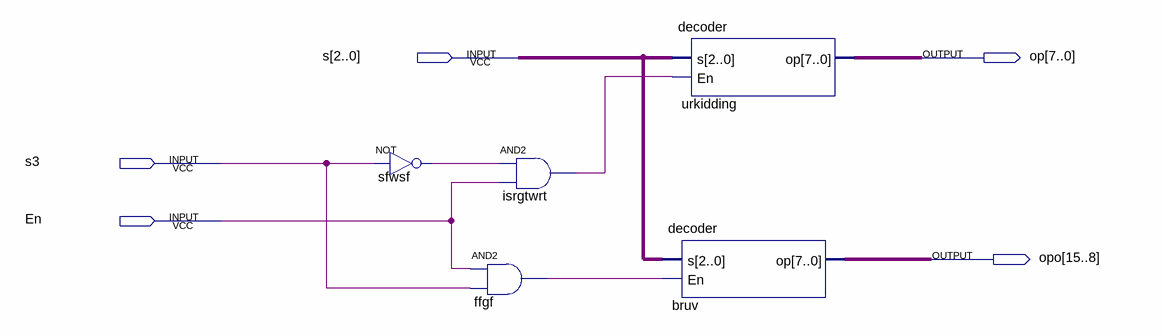
[diagram p0: schematic sheet]
// Quartus schematic comb_decoder.bdf as structural Verilog: 5 symbols, 5 pins
module comb_decoder (
  input  [2:0] s,
  input  s3,
  input  En,
  output [7:0] op,
  output [15:8] opo
);

  wire ffgf_out, isrgtwrt_out, sfwsf_out;

  not sfwsf (sfwsf_out, s3);
  and isrgtwrt (isrgtwrt_out, sfwsf_out, En);
  and ffgf (ffgf_out, En, s3);
  decoder urkidding (.s(s), .En(isrgtwrt_out), .op(op));
  decoder bruv (.s(s), .En(ffgf_out), .op(opo));
endmodule
